# Altium schematic sheet Micro-Switch.SchDoc
size A4; SheetNumber: 11; SheetTotal: 15
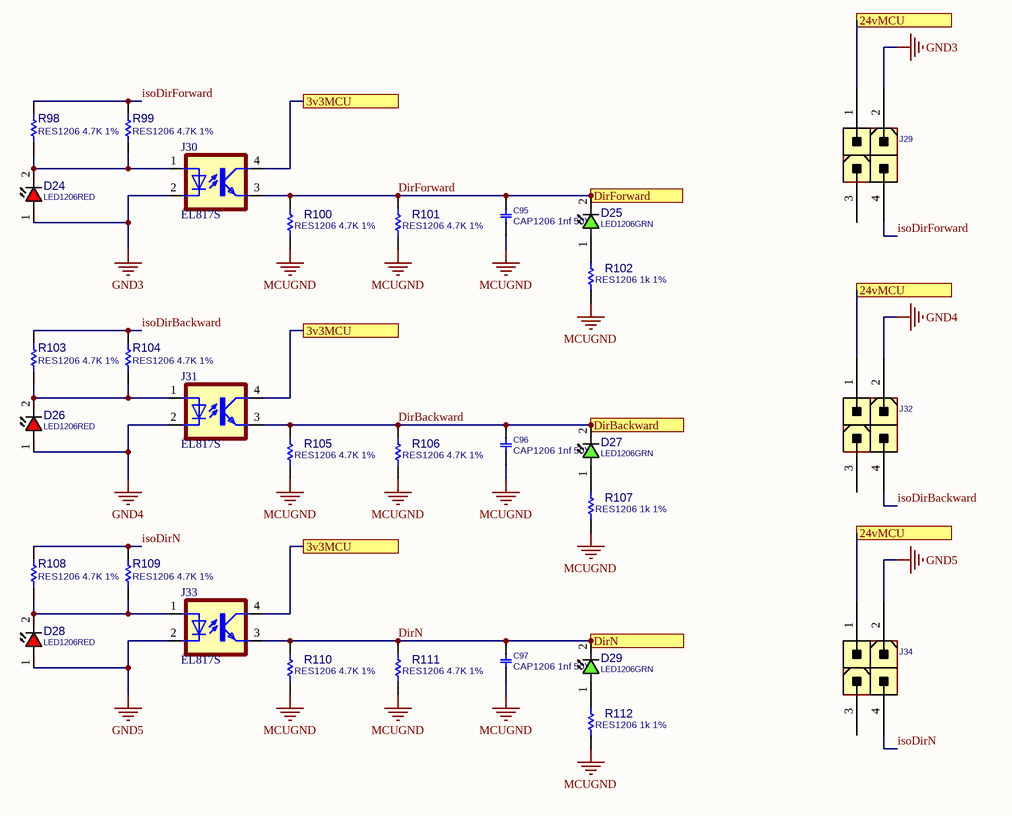
[diagram p0: Micro-Switch.SchDoc]

## Parts
C95  CAP1206 1nf 50V  [C1206]
C96  CAP1206 1nf 50V  [C1206]
C97  CAP1206 1nf 50V  [C1206]
D24  LED1206RED  [LED1206RED]
D25  LED1206GRN  [LED1206GRN]
D26  LED1206RED  [LED1206RED]
D27  LED1206GRN  [LED1206GRN]
D28  LED1206RED  [LED1206RED]
D29  LED1206GRN  [LED1206GRN]
J29  CONN_ATXPWR_4  [ATXPWR_4]  (value not drawn)
J30  EL817S  [SOIC254P1030X460-4N]
J31  EL817S  [SOIC254P1030X460-4N]
J32  CONN_ATXPWR_4  [ATXPWR_4]  (value not drawn)
J33  EL817S  [SOIC254P1030X460-4N]
J34  CONN_ATXPWR_4  [ATXPWR_4]  (value not drawn)
R98  RES1206 4.7K 1%  [R1206]
R99  RES1206 4.7K 1%  [R1206]
R100  RES1206 4.7K 1%  [R1206]
R101  RES1206 4.7K 1%  [R1206]
R102  RES1206 1k 1%  [R1206]
R103  RES1206 4.7K 1%  [R1206]
R104  RES1206 4.7K 1%  [R1206]
R105  RES1206 4.7K 1%  [R1206]
R106  RES1206 4.7K 1%  [R1206]
R107  RES1206 1k 1%  [R1206]
R108  RES1206 4.7K 1%  [R1206]
R109  RES1206 4.7K 1%  [R1206]
R110  RES1206 4.7K 1%  [R1206]
R111  RES1206 4.7K 1%  [R1206]
R112  RES1206 1k 1%  [R1206]

## Ports
3v3MCU, 24vMCU, DirBackward, DirForward, DirN

## Nets
GND3: D24.1(ANODE) J29.2 J30.2(C)
GND4: D26.1(ANODE) J31.2(C) J32.2
GND5: D28.1(ANODE) J33.2(C) J34.2
MCUGND: C95.2 C96.2 C97.2 R100.1 R101.1 R102.1 R105.1 R106.1 R107.1 R110.1 R111.1 R112.1
3v3MCU: J30.4(COL) J31.4(COL) J33.4(COL) ; port 3v3MCU
24vMCU: J29.1 J32.1 J34.1 ; port 24vMCU
DirBackward: C96.1 D27.2(CATHODE) J31.3(EMIT) R105.2 R106.2 ; port DirBackward
DirForward: C95.1 D25.2(CATHODE) J30.3(EMIT) R100.2 R101.2 ; port DirForward
DirN: C97.1 D29.2(CATHODE) J33.3(EMIT) R110.2 R111.2 ; port DirN
isoDirBackward: J32.4 R103.2 R104.2
isoDirForward: J29.4 R98.2 R99.2
isoDirN: J34.4 R108.2 R109.2
NetD24_2: D24.2(CATHODE) J30.1(A) R98.1 R99.1
NetD25_1: D25.1(ANODE) R102.2
NetD26_2: D26.2(CATHODE) J31.1(A) R103.1 R104.1
NetD27_1: D27.1(ANODE) R107.2
NetD28_2: D28.2(CATHODE) J33.1(A) R108.1 R109.1
NetD29_1: D29.1(ANODE) R112.2

Not connected (* = marked no-connect by the designer): J29 3; J32 3; J34 3

## Library data of the parts
C95-C97 = CAP_SMD_MLCC_1206: CAP, MLCC; PARAM: -, -%; MANF_P#: MANF_PART#; PARAM2: -V; PRICE: 100= 1$; MANF: -; ASSEMBLY: ASSEMBLY
D24 D26 D28 = LED_SMD_1206_RED: LED, SMD, 1206, RED; DESC: DESCRIPTION; MANF_P#: MANF_PART#; PARAM2: 1.7~2.4V; MANF: MANF; ASSEMBLY: ASSEMBLY; PRICE: 36t@Javan; VALUE: LED1206RED; MountType: SMT; PartType: LED
D25 D27 D29 = LED_SMD_1206_GRN: LED, SMD, 1206, GREEN; PARAM: 20mA; DESC: DESCRIPTION; PARAM2: 2.2V; MANF: -; ASSEMBLY: ASSEMBLY; PRICE: 36t@Javan; MANF_P#: -; VALUE: LED1206GRN; MountType: SMT; PartType: LED
J29 J32 J34 = CONN_ATXPWR_4: CONN, ATX POWER, 4 P; MANF: TE, Molex; MANF_P#: 4-1775099-0, 39281043; VALUE: CONN_ATXPWR_4; MountType: THD; PACKAGE: ATXPWR-4pin; Part Type: Conn.
J30 J31 J33 = EL817S: Optoisolator Transistor Output 5000Vrms 1 Channel 4-SMD; MF: Everlight Electronics; SnapEDA_Link: https://www.snapeda.com/parts/EL817S/Everlight+Electronics+Co+Ltd/view-part/?ref=snap; Package: SMD-4 Everlight Electronics Co Ltd; Value: *; MP: EL817S; Check_prices: https://www.snapeda.com/parts/EL817S/Everlight+Electronics+Co+Ltd/view-part/?ref=eda
R98-R112 = RES_SMD_1206: RESISTOR, SMD; PARAM: 1%, 0.25W; DESC: DESCRIPTION; DIST#: MOUSER; MANF_P#: -; MANF: -; ASSEMBLY: ASSEMBLY; PRICE: -; PARAM2: -